# Altium project HMS.PhaoDien.V6.0.PrjPcb (part 1 of 2)
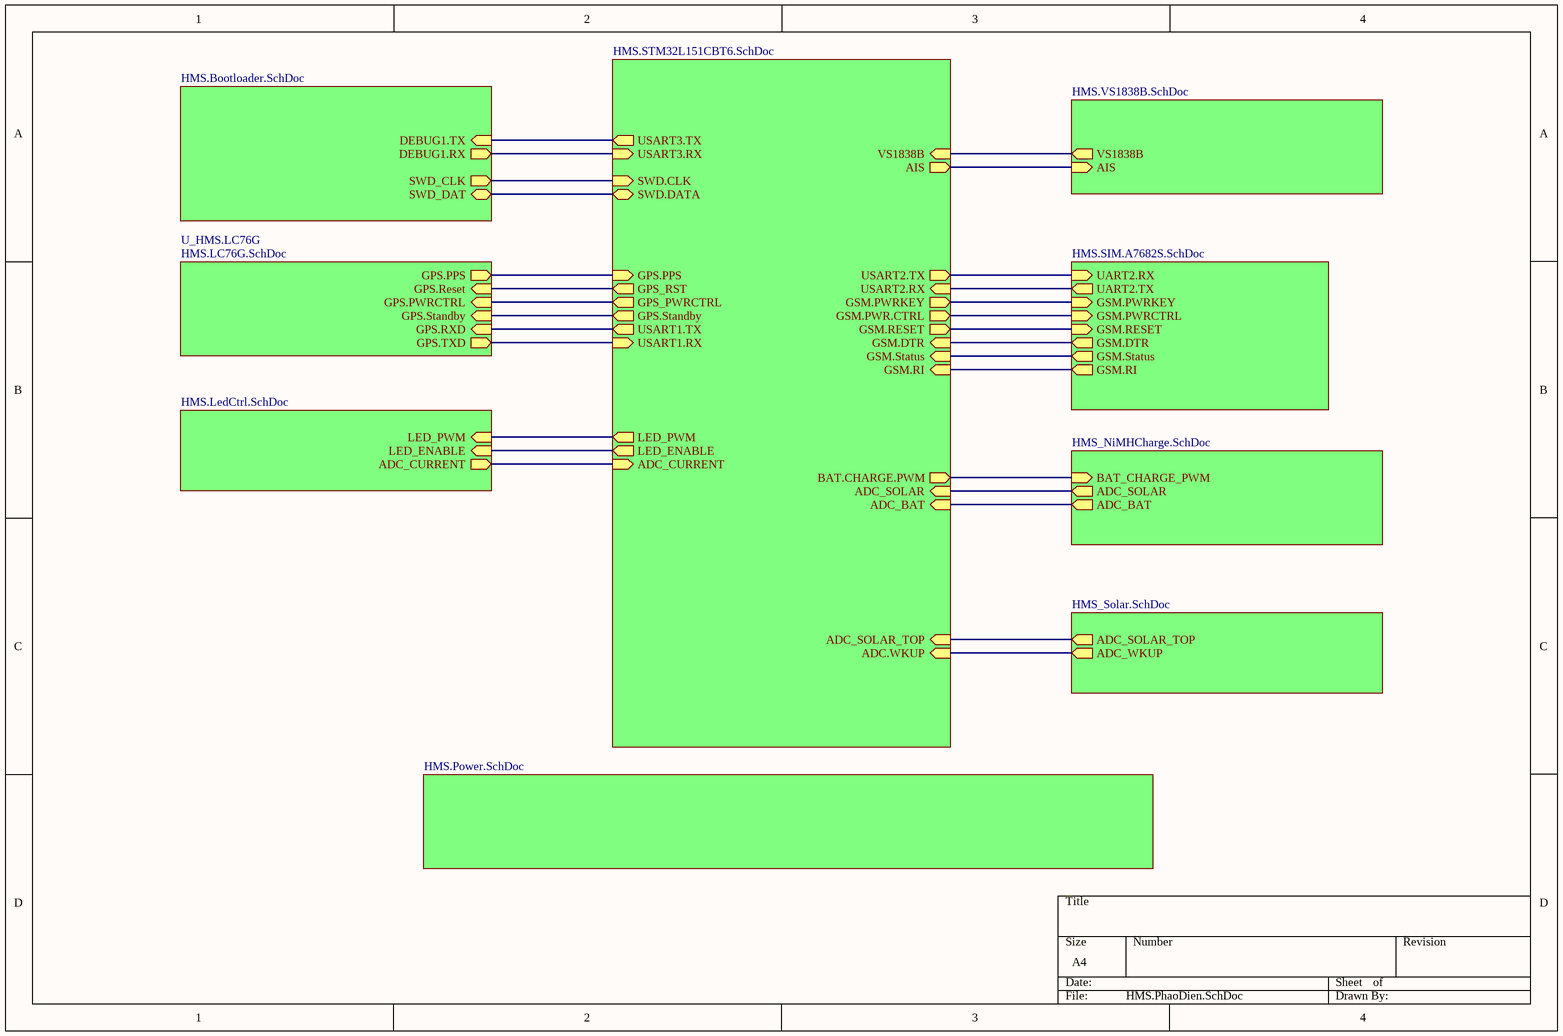
[diagram p0: HMS.PhaoDien.SchDoc]
10 sheets, 125 parts. Net scope: hierarchical (ports join the sheet entries above them; power ports are global).
Board file: 2026.11.05.HMS.PD.CNHH.V6.0.PcbDoc
Sheets:
  HMS.PhaoDien.SchDoc
     = HMS.STM32L151CBT6.SchDoc
     = HMS.Bootloader.SchDoc
     = HMS.LedCtrl.SchDoc
     = HMS.Power.SchDoc
     = HMS.VS1838B.SchDoc
     = HMS_NiMHCharge.SchDoc
     = HMS_Solar.SchDoc
    U_HMS.SIM.A7677S = HMS.SIM.A7682S.SchDoc
    U_HMS.LC76G = HMS.LC76G.SchDoc

## Sheet HMS.PhaoDien.SchDoc
size A4

### Sub-sheets
U_HMS.LC76G = HMS.LC76G.SchDoc: GPS.TXD (out), GPS.RXD (in), GPS.Reset (in), GPS.PWRCTRL (in), GPS.PPS (out), GPS.Standby (in)
U_HMS.SIM.A7677S = HMS.SIM.A7682S.SchDoc: GSM.PWRCTRL (in), GSM.PWRKEY (in), GSM.RESET (in), UART2.RX (in), UART2.TX (out), GSM.DTR (out), GSM.Status (out), GSM.RI (out)
? = HMS.STM32L151CBT6.SchDoc: SWD.DATA (bidir), SWD.CLK (in), LED_PWM (out), LED_ENABLE (out), ADC_CURRENT (in), ADC_SOLAR_TOP (in), ADC_BAT (in), ADC_SOLAR (in), BAT.CHARGE.PWM (out), GPS_RST (out), GPS_PWRCTRL (out), GSM.PWRKEY (out), VS1838B (in), AIS (out), USART1.TX (out), USART1.RX (in), USART2.TX (out), USART2.RX (in), GSM.PWR.CTRL (out), GSM.RESET (out), USART3.TX (out), USART3.RX (in), ADC.WKUP (in), GPS.PPS (in), GSM.RI (in), GSM.Status (in), GSM.DTR (in), GPS.Standby (out)
? = HMS.Bootloader.SchDoc: SWD_CLK (out), SWD_DAT (bidir), DEBUG1.TX (in), DEBUG1.RX (out)
? = HMS.LedCtrl.SchDoc: ADC_CURRENT (out), LED_ENABLE (in), LED_PWM (in)
? = HMS.Power.SchDoc: no entries
? = HMS.VS1838B.SchDoc: VS1838B (out), AIS (in)
? = HMS_NiMHCharge.SchDoc: ADC_SOLAR (out), BAT_CHARGE_PWM (in), ADC_BAT (out)
? = HMS_Solar.SchDoc: ADC_SOLAR_TOP (out), ADC_WKUP (out)

### Nets
USART2.TX: sheet /USART2.TX, sheet U_HMS.SIM.A7677S/UART2.RX
NetC603_2: sheet /ADC_CURRENT, sheet /ADC_CURRENT
NetC801_2: sheet /ADC_SOLAR, sheet /ADC_SOLAR
NetC803_2: sheet /ADC_BAT, sheet /ADC_BAT
NetC900_2: sheet /ADC_SOLAR_TOP, sheet /ADC_SOLAR_TOP
NetIC_2: sheet /LED_ENABLE, sheet /LED_ENABLE
NetMD500_4: sheet /GPS.PPS, sheet U_HMS.LC76G/GPS.PPS
NetMD500_5: sheet /GPS.Standby, sheet U_HMS.LC76G/GPS.Standby
NetMD500_9: sheet /GPS_RST, sheet U_HMS.LC76G/GPS.Reset
NetP2_4: sheet /GSM.DTR, sheet U_HMS.SIM.A7677S/GSM.DTR
NetP2_5: sheet /USART2.RX, sheet U_HMS.SIM.A7677S/UART2.TX
NetP2_6: sheet /GSM.RI, sheet U_HMS.SIM.A7677S/GSM.RI
NetP2_7: sheet /GSM.Status, sheet U_HMS.SIM.A7677S/GSM.Status
NetP2_8: sheet /GSM.PWRKEY, sheet U_HMS.SIM.A7677S/GSM.PWRKEY
NetP2_9: sheet /GSM.RESET, sheet U_HMS.SIM.A7677S/GSM.RESET
NetP2_10: sheet /GSM.PWR.CTRL, sheet U_HMS.SIM.A7677S/GSM.PWRCTRL
NetP100_3: sheet /SWD.CLK, sheet /SWD_CLK
NetP100_7: sheet /SWD.DATA, sheet /SWD_DAT
NetP300_1: sheet /VS1838B, sheet /VS1838B
NetR100_2: sheet /USART3.TX, sheet /DEBUG1.TX
NetR102_2: sheet /USART3.RX, sheet /DEBUG1.RX
NetR500_2: sheet /USART1.RX, sheet U_HMS.LC76G/GPS.TXD
NetR501_2: sheet /USART1.TX, sheet U_HMS.LC76G/GPS.RXD
NetR503_1: sheet /GPS_PWRCTRL, sheet U_HMS.LC76G/GPS.PWRCTRL
NetR604_1: sheet /LED_PWM, sheet /LED_PWM
NetR805_1: sheet /BAT.CHARGE.PWM, sheet /BAT_CHARGE_PWM
NetR902_2: sheet /ADC.WKUP, sheet /ADC_WKUP
NetT300_1: sheet /AIS, sheet /AIS

## Sheet HMS.STM32L151CBT6.SchDoc: HMS.STM32L151CBT6
size A3
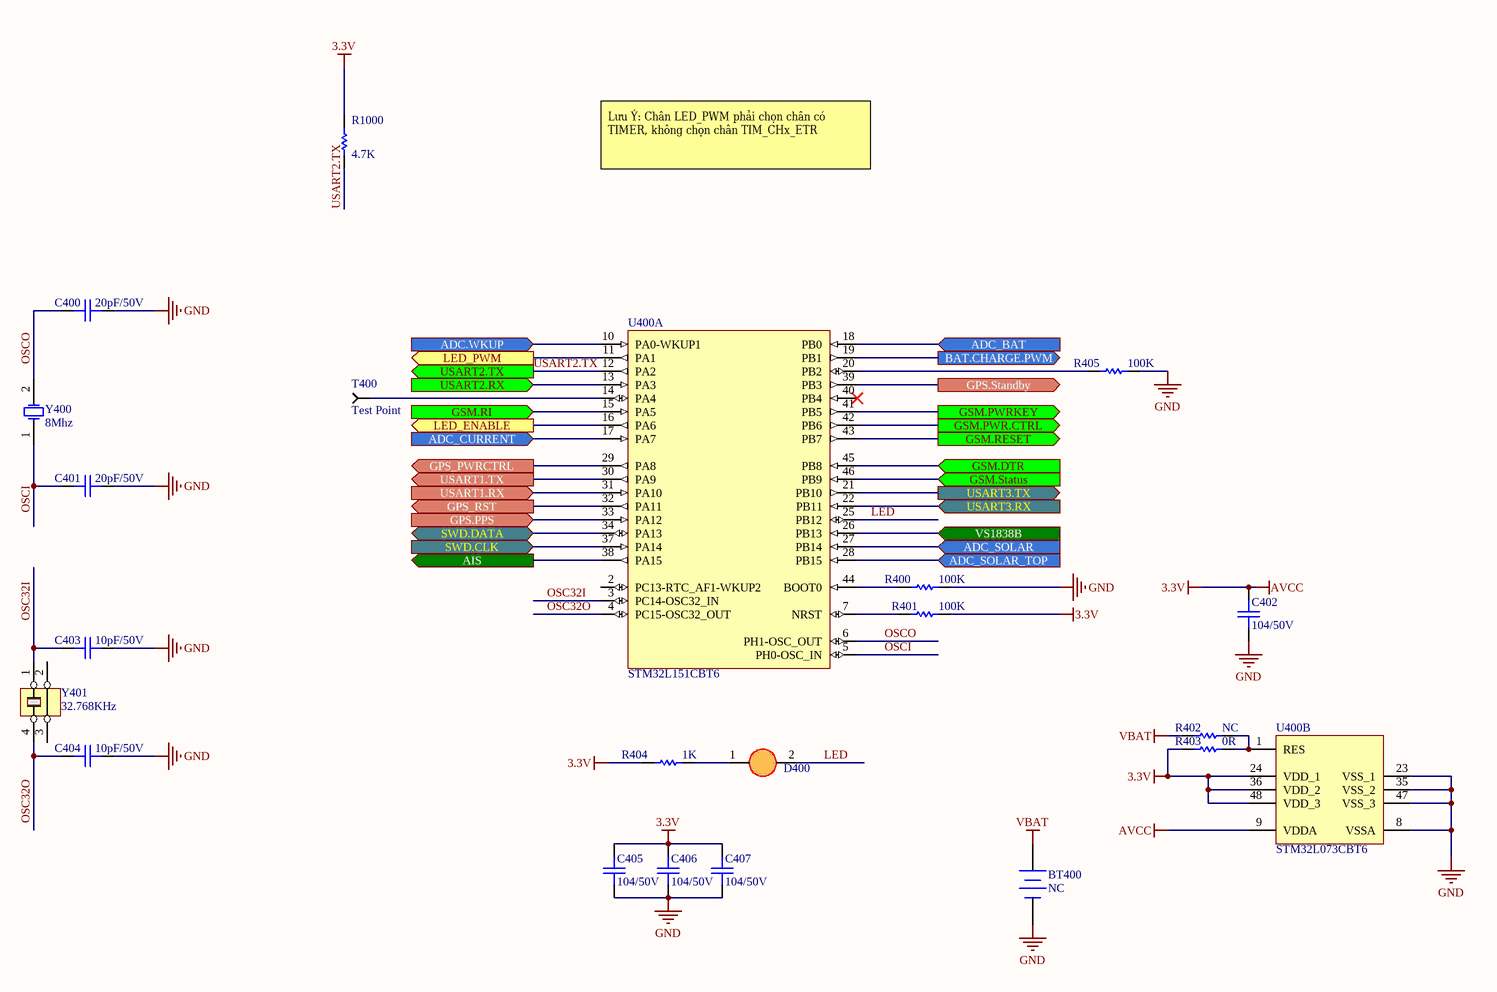
[diagram p1: HMS.STM32L151CBT6.SchDoc]

### Parts
BT400  NC  [DE PIN NHO 3V3]
C400  20pF/50V  [CAP_CERAMIC_0402(1005)]
C401  20pF/50V  [CAP_CERAMIC_0402(1005)]
C402  104/50V  [CAP_CERAMIC_0402(1005)]
C403  10pF/50V  [CAP_CERAMIC_0402(1005)]
C404  10pF/50V  [CAP_CERAMIC_0402(1005)]
C405  104/50V  [CAP_CERAMIC_0402(1005)]
C406  104/50V  [CAP_CERAMIC_0402(1005)]
C407  104/50V  [CAP_CERAMIC_0402(1005)]
D400  LED Red  [LED_0603_GREEN]  (value not drawn)
R400  100K  [RES_0402(1005)]
R401  100K  [RES_0402(1005)]
R402  NC  [RES_0402(1005)]
R403  0R  [RES_0402(1005)]
R404  1K  [RES_0402(1005)]
R405  100K  [RES_0402(1005)]
R1000  4.7K  [RES_0402(1005)]
T400  Test Point  [Test Point SMD]
U400  STM32L151CBT6  [LQFP48_L]  (parts A,B of 2)
Y400  8Mhz  [CRYSTAL_SMD_2PIN-5032]
Y401  32.768KHz  [ABS25-32768-6-T]

### Ports
ADC.WKUP (in), ADC_BAT (in), ADC_CURRENT (in), ADC_SOLAR (in), ADC_SOLAR_TOP (in), AIS (out), BAT.CHARGE.PWM (out), GPS.PPS (in), GPS.Standby (out), GPS_PWRCTRL (out), GPS_RST (out), GSM.DTR (in), GSM.PWR.CTRL (out), GSM.PWRKEY (out), GSM.RESET (out), GSM.RI (in), GSM.Status (in), LED_ENABLE (out), LED_PWM (out), SWD.CLK (in), SWD.DATA (bidir), USART1.RX (in), USART1.TX (out), USART2.RX (in), USART2.TX (out), USART3.RX (in), USART3.TX (out), VS1838B (in)

### Nets
3.3V: C402.2 C405.2 C406.2 C407.2 R401.2 R403.1 R404.1 R1000.2 U400.9(VDDA) U400.24(VDD_1) U400.36(VDD_2) U400.48(VDD_3)  [also labelled AVCC]
GND: BT400.2(-) C400.1 C401.1 C402.1 C403.1 C404.1 C405.1 C406.1 C407.1 R400.1 R405.1 U400.8(VSSA) U400.23(VSS_1) U400.35(VSS_2) U400.47(VSS_3)
VBAT: BT400.1(+) R402.1
LED: D400.2(K) U400.25(PB12)
OSC32I: C403.2 U400.3(PC14-OSC32_IN) Y401.1
OSC32O: C404.2 U400.4(PC15-OSC32_OUT) Y401.4
OSCI: C401.2 U400.5(PH0-OSC_IN) Y400.1(OSC1)
OSCO: C400.2 U400.6(PH1-OSC_OUT) Y400.2(OSC2)
USART2.TX: R1000.1 U400.12(PA2) ; port USART2.TX
NetC603_2: U400.17(PA7) ; port ADC_CURRENT
NetC801_2: U400.27(PB14) ; port ADC_SOLAR
NetC803_2: U400.18(PB0) ; port ADC_BAT
NetC900_2: U400.28(PB15) ; port ADC_SOLAR_TOP
NetD400_1: D400.1(A) R404.2
NetIC_2: U400.16(PA6) ; port LED_ENABLE
NetMD500_4: U400.33(PA12) ; port GPS.PPS
NetMD500_5: U400.39(PB3) ; port GPS.Standby
NetMD500_9: U400.32(PA11) ; port GPS_RST
NetP2_4: U400.45(PB8) ; port GSM.DTR
NetP2_5: U400.13(PA3) ; port USART2.RX
NetP2_6: U400.15(PA5) ; port GSM.RI
NetP2_7: U400.46(PB9) ; port GSM.Status
NetP2_8: U400.41(PB5) ; port GSM.PWRKEY
NetP2_9: U400.43(PB7) ; port GSM.RESET
NetP2_10: U400.42(PB6) ; port GSM.PWR.CTRL
NetP100_3: U400.37(PA14) ; port SWD.CLK
NetP100_7: U400.34(PA13) ; port SWD.DATA
NetP300_1: U400.26(PB13) ; port VS1838B
NetR100_2: U400.21(PB10) ; port USART3.TX
NetR102_2: U400.22(PB11) ; port USART3.RX
NetR400_2: R400.2 U400.44(BOOT0)
NetR401_1: R401.1 U400.7(NRST)
NetR402_2: R402.2 R403.2 U400.1(RES)
NetR405_2: R405.2 U400.20(PB2)
NetR500_2: U400.31(PA10) ; port USART1.RX
NetR501_2: U400.30(PA9) ; port USART1.TX
NetR503_1: U400.29(PA8) ; port GPS_PWRCTRL
NetR604_1: U400.11(PA1) ; port LED_PWM
NetR805_1: U400.19(PB1) ; port BAT.CHARGE.PWM
NetR902_2: U400.10(PA0-WKUP1) ; port ADC.WKUP
NetT300_1: U400.38(PA15) ; port AIS
NetT400_1: T400.1 U400.14(PA4)

Not connected (* = marked no-connect by the designer): U400 2(PC13-RTC_AF1-WKUP2) 40(PB4)*; Y401 2 3

### Notes on the sheet
- Lưu Ý: Chân LED_PWM phải chọn chân có TIMER, không chọn chân TIM_CHx_ETR
- Title
- Size:
- Date:
- A3
- Number:
- Time:
- Revision:
- Sheet
- of
- File:

### Library data of the parts
BT400 = Battery: Published: 24-Mar-1999; LatestRevisionDate: 17-Jul-2002; LatestRevisionNote: Re-released for DXP Platform.; PackageReference: BAT-2; Publisher: Altium Limited; PackageDescription: Battery; 2 Leads; Value: NC
C400 C401 = Cap Cer 0603 (1608): CAP CER 20PF 50V C0G/NP0 0402; MPN: CQ0402FRNPO9BN200; Published: 8-Jun-2000; LatestRevisionDate: 17-Jul-2002; LatestRevisionNote: Re-released for DXP Platform.; PackageReference: RAD-0.3; Publisher: Altium Limited; Value: 20pF/50V
C402 C405-C407 = C0603C104K5RACTU: CAP CER 0.1UF 50V X5R 0402; MPN: CC0402KRX5R9BB104; CompanyID: VT-00982; Solder: SMT; Value: 104/50V; Category: CAPACITOR
C403 C404 = Cap Cer 0603 (1608): CAP CER 10pF 50V NP0 0402; MPN: CC0402JRNPO9BN100; Published: 8-Jun-2000; LatestRevisionDate: 17-Jul-2002; LatestRevisionNote: Re-released for DXP Platform.; PackageReference: RAD-0.3; Publisher: Altium Limited; Value: 10pF/50V
D400 = LED 3mm: LED RED SMD 0402; MPN: NCD0603R1; Value: LED Red
R400 R401 R405 = Res1: Resistor 100K 1/8W 1% 0402; MPN: RC0402FR-07100KL; Published: 8-Jun-2000; LatestRevisionDate: 17-Jul-2002; LatestRevisionNote: Re-released for DXP Platform.; PackageReference: AXIAL-0.3; Publisher: Altium Limited; Value: 100K
R402 = Res1: Resistor; Published: 8-Jun-2000; LatestRevisionDate: 17-Jul-2002; LatestRevisionNote: Re-released for DXP Platform.; PackageReference: AXIAL-0.3; Publisher: Altium Limited; Value: NC
R403 = Res1: RES 0 OHM 1/8W 0402; MPN: CRCW04020000Z0EDC; Published: 8-Jun-2000; LatestRevisionDate: 17-Jul-2002; LatestRevisionNote: Re-released for DXP Platform.; PackageReference: AXIAL-0.3; Publisher: Altium Limited; Value: 0R
R404 = Res1: RES 1K OHM 1% 1/8W 0402; MPN: RC0402FR-071KL; Published: 8-Jun-2000; LatestRevisionDate: 17-Jul-2002; LatestRevisionNote: Re-released for DXP Platform.; PackageReference: AXIAL-0.3; Publisher: Altium Limited; Value: 1K
R1000 = Res1: RES 4.7kΩ ±1% 62.5mW 0402; MPN: RC0402FR-074K7L; MFR: Vishay Dale; Published: 8-Jun-2000; LatestRevisionDate: 17-Jul-2002; LatestRevisionNote: Re-released for DXP Platform.; PackageReference: AXIAL-0.3; Publisher: Altium Limited; PackageDescription: Axial Device, Thru-Hole; 2 Leads; 0.3 in Pin Spacing; Value: 4.7K; Category: Chip Resistor - Surface Mount
U400 = STM32L151CBT6: STM32L ARM-based EnergyLite 32-bit MCU, 128 kB Flash, 16 kB Internal RAM, -40 to +85°C Temperature, 32-pin LQFP, Tray; DatasheetVersion: rev6, Jan-2012; PackageVersion: rev13, Apr-2011; PackageReference: LQFP48; PackageDescription: 48-Pin Low-Profile Quad Flat Pack, 7 x 7 mm Body, 0.5 mm Pitch (LQFP48); ComponentLink1Description: Manufacturer URL; ComponentLink1URL: http://www.st.com/; ComponentLink2Description: STM32L151/152 Datasheet; ComponentLink2URL: http://www.st.com/internet/com/TECHNICAL_RESOURCES/TECHNICAL_LITERATURE/DATASHEET/CD00277537.pdf; ComponentLink3Description: STM32 L1 Family Web Page; ComponentLink3URL: http://www.st.com/internet/mcu/subclass/1376.jsp; Value: STM32L151CBT6; MPN: STM32L151CBT6
Y400 = XTAL: Crystal 8Mhz 20pF SMD 5032; MPN: ABM3-8.000MHz-12-D4Y-T; Published: 8-Jun-2000; LatestRevisionDate: 17-Jul-2002; LatestRevisionNote: Re-released for DXP Platform.; PackageReference: R38; Publisher: Altium Limited; PackageDescription: Crystal, Thru-Hole; 2 Leads; Body 3.1 x 8.2 mm (Dia.xH); Value: 8Mhz
Y401 = ABS25-32768-6-T: CRYSTAL 32.768KHZ 6PF SMD; Manufacturer: Abracon Corporation; Manufacturer Part Number: ABS25-32.768KHZ-6-T; Frequency Tolerance: ±20ppm; ESR (Equivalent Series Resistance): 50 kOhm; Operating Mode: Fundamental; Supplier 1: Digi-Key; RoHS: RoHS Compliant; Category: Crystals and Oscillators; Stock 1: 51000; Pricing 1: 3000=0.285, 6000=0.2755, 15000=0.266 (USD); Packaging: Tape & Reel (TR); Type: kHz Crystal (Tuning Fork); Frequency: 32.768kHz; Frequency Stability: -; Load Capacitance: 6pF; Operating Temperature: -40°C ~ 85°C; Ratings: -; Mounting Type: Surface Mount; Package / Case: 4-SOJ, 5.50mm pitch; Size / Dimension: 0.315" L x 0.150" W (8.00mm x 3.80mm); Height: 0.098" (2.50mm); ComponentLink1URL: http://www.abracon.com/Resonators/abs25.pdf; ComponentLink1Description: http://www.abracon.com/Resonators/abs25.pdf; Supplier Part Number 1: 535-10240-2-ND; Value: 32.768KHz; MPN: ABS25-32768-6-T

## Sheet HMS.Bootloader.SchDoc
size A
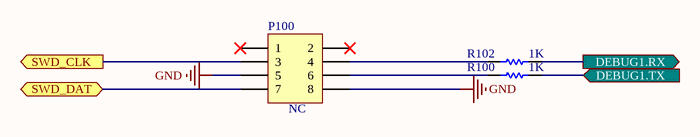
[diagram p2: HMS.Bootloader.SchDoc]

### Parts
P100  NC  [HDR2X4]
R100  1K  [RES_0402(1005)]
R102  1K  [RES_0402(1005)]

### Ports
DEBUG1.RX (out), DEBUG1.TX (in), SWD_CLK (out), SWD_DAT (bidir)

### Nets
GND: P100.5 P100.8
NetP100_3: P100.3 ; port SWD_CLK
NetP100_4: P100.4 R102.1
NetP100_6: P100.6 R100.1
NetP100_7: P100.7 ; port SWD_DAT
NetR100_2: R100.2 ; port DEBUG1.TX
NetR102_2: R102.2 ; port DEBUG1.RX

Not connected (* = marked no-connect by the designer): P100 1* 2*

### Library data of the parts
P100 = Header 4X2: Header, 4-Pin, Dual row; LatestRevisionDate: 17-Jul-2002; LatestRevisionNote: Re-released for DXP Platform.; Publisher: Altium Limited; MPN: NC; Value: NC
R100 R102 = Res1: as R404 on sheet HMS.STM32L151CBT6; Published: 8-Jun-2000; LatestRevisionDate: 17-Jul-2002; LatestRevisionNote: Re-released for DXP Platform.; PackageReference: AXIAL-0.3; Publisher: Altium Limited; Value: 1K

## Sheet HMS.LedCtrl.SchDoc
size A
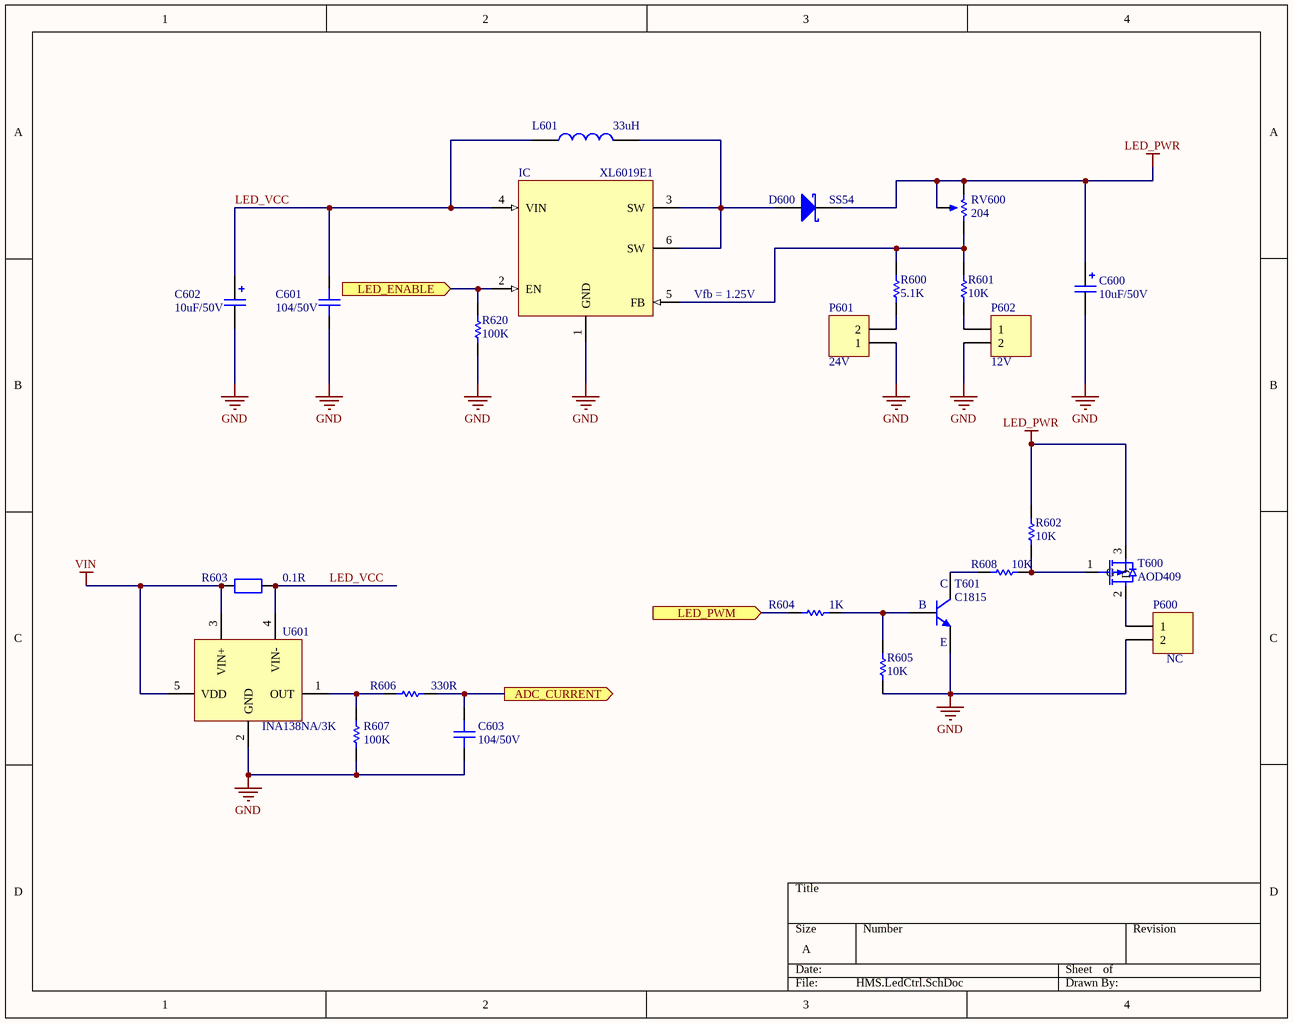
[diagram p3: HMS.LedCtrl.SchDoc]

### Parts
C600  10uF/50V  [CAP_ALUM_SMD_5054_TYPE_C]
C601  104/50V  [CAP_CERAMIC_0402(1005)]
C602  10uF/50V  [CAP_ALUM_SMD_5054_TYPE_C]
C603  104/50V  [CAP_CERAMIC_0402(1005)]
D600  SS54  [DO214AC_SMA_1808]
IC  XL6019E1  [TO-263-5]
L601  33uH  [L3A_10x10x4mm]
P600  NC  [H2_BIG]
P601  24V  [HDR1X2]
P602  12V  [HDR1X2]
R600  5.1K  [RES_0402(1005)]
R601  10K  [RES_0402(1005)]
R602  10K  [RES_0402(1005)]
R603  0.1R  [RES_2512]
R604  1K  [RES_0402(1005)]
R605  10K  [RES_0402(1005)]
R606  330R  [RES_0402(1005)]
R607  100K  [RES_0402(1005)]
R608  10K  [RES_0402(1005)]
R620  100K  [RES_0402(1005)]
RV600  204  [RES_VAR_Type1]
T600  AOD409  [TO252]
T601  C1815  [SOT23-3]
U601  INA138NA/3K  [SOT23-5]

### Ports
ADC_CURRENT (out), LED_ENABLE (in), LED_PWM (in)

### Nets
GND: C600.2 C601.1 C602.2 C603.1 IC.1(GND) P600.2 P601.1 P602.2 R605.1 R607.1 R620.1 T601.2 U601.2(GND)
LED_PWR: C600.1 D600.2(K) R602.2 RV600.2 RV600.3 T600.3(S)
VIN: R603.1 U601.3(VIN+) U601.5(VDD)
LED_VCC: C601.2 C602.1 IC.4(VIN) L601.1 R603.2 U601.4(VIN-)
NetC603_2: C603.2 R606.2 ; port ADC_CURRENT
NetD600_1: D600.1(A) IC.3(SW) IC.6(SW) L601.2
NetIC_2: IC.2(EN) R620.2 ; port LED_ENABLE
NetIC_5: IC.5(FB) R600.2 R601.2 RV600.1
NetP600_1: P600.1 T600.2(D)
NetP601_2: P601.2 R600.1
NetP602_1: P602.1 R601.1
NetR602_1: R602.1 R608.1 T600.1(G)
NetR604_1: R604.1 ; port LED_PWM
NetR604_2: R604.2 R605.2 T601.1
NetR606_1: R606.1 R607.2 U601.1(OUT)
NetR608_2: R608.2 T601.3

### Notes on the sheet
- (near IC) Vfb = 1.25V
- (in symbol 2SC1815-HF) C; B; E

### Library data of the parts
C600 C602 = Cap Tantal 2917 (7343-31): Capacitor Alum 10uF/50V SMD 5x5.4mm; MPN: AVS106M50C12T-F; Value: 10uF/50V
C601 = Cap Cer 0805 (2012): CAP CER 0.1UF 50V X5R 0402; MPN: CC0402KRX5R9BB104; Published: 8-Jun-2000; LatestRevisionDate: 17-Jul-2002; LatestRevisionNote: Re-released for DXP Platform.; PackageReference: RAD-0.3; Publisher: Altium Limited; Value: 104/50V
C603 = Cap Cer 0603 (1608): CAP CER 0.1UF 50V X5R 0402; MPN: CC0402KRX5R9BB104; Published: 8-Jun-2000; LatestRevisionDate: 17-Jul-2002; LatestRevisionNote: Re-released for DXP Platform.; PackageReference: RAD-0.3; Publisher: Altium Limited; Value: 104/50V
D600 = Diode B340A: Diode Schottky 5A/40V DO-214AB; Published: 8-Jun-2000; LatestRevisionDate: 17-Jul-2002; LatestRevisionNote: Re-released for DXP Platform.; PackageReference: SMB; Publisher: Altium Limited; Code_JEDEC: DO-214-AA; MPN: SS54; Value: SS54
IC = XL6019E1: XL6019E1 IC Boost 5A TO-263-5; MPN: XL6019E1; Value: XL6019E1
L601 = CBC2012T470M: INDUCTOR 33uH SMD CDRH127-330; Manufacturer: Taiyo Yuden; Inductance: 47uH; Current Rating: 150mA; Current - Saturation: 120mA; Tolerance: ±20%; Shielding: Unshielded; DC Resistance (DCR): 7.54 Ohm Max; Frequency - Self Resonant: 11MHz; Frequency - Test: 2.52MHz; Supplier 1: Digi-Key; Manufacturer Part Number: CBC2012T470M; RoHS: RoHS Compliant; Category: Inductors, Coils, Chokes; Stock 1: 108934; Pricing 1: 1=0.2, 10=0.188, 50=0.1762, 100=0.1645, 500=0.12926, 1000=0.10575 (USD); Packaging: Cut Tape (CT); Type: -; Material - Core: -; Q @ Freq: -; Operating Temperature: -40°C ~ 105°C; Package / Case: 0805 (2012 Metric); Size / Dimension: 0.079" L x 0.049" W x 0.049" H (2.00mm x 1.25mm x 1.25mm); Mounting Type: Surface Mount; ComponentLink1URL: http://www.yuden.co.jp/ut/product/category/inductor/CBC2012T470M.pdf; ComponentLink1Description: http://www.yuden.co.jp/ut/product/category/inductor/CBC2012T470M.pdf; Supplier Part Number 1: 587-1605-1-ND; Value: 33uH; MPN: CDRH127-330
P600 = Header 2: Header, 2-Pin; LatestRevisionDate: 17-Jul-2002; LatestRevisionNote: Re-released for DXP Platform.; Publisher: Altium Limited; Value: NC; MPN: NC
P601 P602 = Header 2: Header, 2-Pin; MPN: NC; LatestRevisionDate: 17-Jul-2002; LatestRevisionNote: Re-released for DXP Platform.; Publisher: Altium Limited
R600 = Res1: RES 5.1K OHM 5% 1/8W 0402; MPN: RC0402JR-075K1L; Published: 8-Jun-2000; LatestRevisionDate: 17-Jul-2002; LatestRevisionNote: Re-released for DXP Platform.; PackageReference: AXIAL-0.3; Publisher: Altium Limited; Value: 5.1K
R601 R602 R605 R608 = Res1: RES 10K OHM 5% 1/8W 0402; MPN: RC0402JR-0710KL; Published: 8-Jun-2000; LatestRevisionDate: 17-Jul-2002; LatestRevisionNote: Re-released for DXP Platform.; PackageReference: AXIAL-0.3; Publisher: Altium Limited; Value: 10K
R603 = Res 1W: Res 1W 0.1R 1% SMD 2512; MPN: RL2512FK-070R1L; Value: 0.1R
R604 = Res1: as R404 on sheet HMS.STM32L151CBT6; Published: 8-Jun-2000; LatestRevisionDate: 17-Jul-2002; LatestRevisionNote: Re-released for DXP Platform.; PackageReference: AXIAL-0.3; Publisher: Altium Limited; Value: 1K
R606 = Res1: RES 330 OHM 1% 1/8W 0402; MPN: RC0402FR-07330RL; Published: 8-Jun-2000; LatestRevisionDate: 17-Jul-2002; LatestRevisionNote: Re-released for DXP Platform.; PackageReference: AXIAL-0.3; Publisher: Altium Limited; Value: 330R
R607 = Res1: as R400 on sheet HMS.STM32L151CBT6; Published: 8-Jun-2000; LatestRevisionDate: 17-Jul-2002; LatestRevisionNote: Re-released for DXP Platform.; PackageReference: AXIAL-0.3; Publisher: Altium Limited; Value: 100K
R620 = Res1: RES 100K OHM 5% 1/8W 0402; MPN: RC0402JR-07100KL; Published: 8-Jun-2000; LatestRevisionDate: 17-Jul-2002; LatestRevisionNote: Re-released for DXP Platform.; PackageReference: AXIAL-0.3; Publisher: Altium Limited; Value: 100K
RV600 = Res_Vol_Single: Volume Varistor Single 200K; MPN: 3296W-204; Sim Note: Enter the Resistance value and the set point into parameter fields.; Set Position: 0.5; Published: 8-Jun-2000; LatestRevisionDate: 17-Jul-2002; LatestRevisionNote: Re-released for DXP Platform.; PackageReference: 3296W-204; Publisher: Altium Limited; Value: 204
T600 = AOD4185: MOSFET P-CH 60V 26A TO252; Manufacturer: International Rectifier; FET Type: MOSFET P-Channel, Metal Oxide; FET Feature: Logic Level Gate; Drain to Source Voltage (Vdss): 20V; Current - Continuous Drain (Id) @ 25° C: 3.7A (Ta); Rds On (Max) @ Id, Vgs: 65 mOhm @ 3.7A, 4.5V; Vgs(th) (Max) @ Id: 1.2V @ 250µA; Gate Charge (Qg) @ Vgs: 12nC @ 5V; Input Capacitance (Ciss) @ Vds: 633pF @ 10V; Power - Max: 1.3W; Supplier 1: Digi-Key; RoHS: RoHS Compliant; Category: Discrete Semiconductor Products; Stock 1: 4068; Pricing 1: 1=0.6, 10=0.34, 25=0.2932, 50=0.2468, 100=0.2209, 250=0.20072, 500=0.18058, 1000=0.16904 (USD); Packaging: Digi-Reel®; Mounting Type: Surface Mount; Package / Case: TO-236-3, SC-59, SOT-23-3; Supplier Device Package: Micro3™/SOT-23; ComponentLink1URL: http://www.irf.com/product-info/datasheets/data/irlml6402gpbf.pdf; ComponentLink1Description: http://www.irf.com/product-info/datasheets/data/irlml6402gpbf.pdf; Supplier Part Number 1: IRLML6402GTRPBFDKR-ND; Value: AOD409; MPN: AOD409
T601 = 2SC1815-HF: Trans C1815 NPN 0.15A/50V SMD SOT23; Value: C1815; MPN: 2SC1815
U601 = INA138: IC Current Monitor Regulator 0.5% SOT-23-5; Value: INA138NA/3K; MPN: INA138NA/3K

## Sheet HMS.Power.SchDoc
size A4
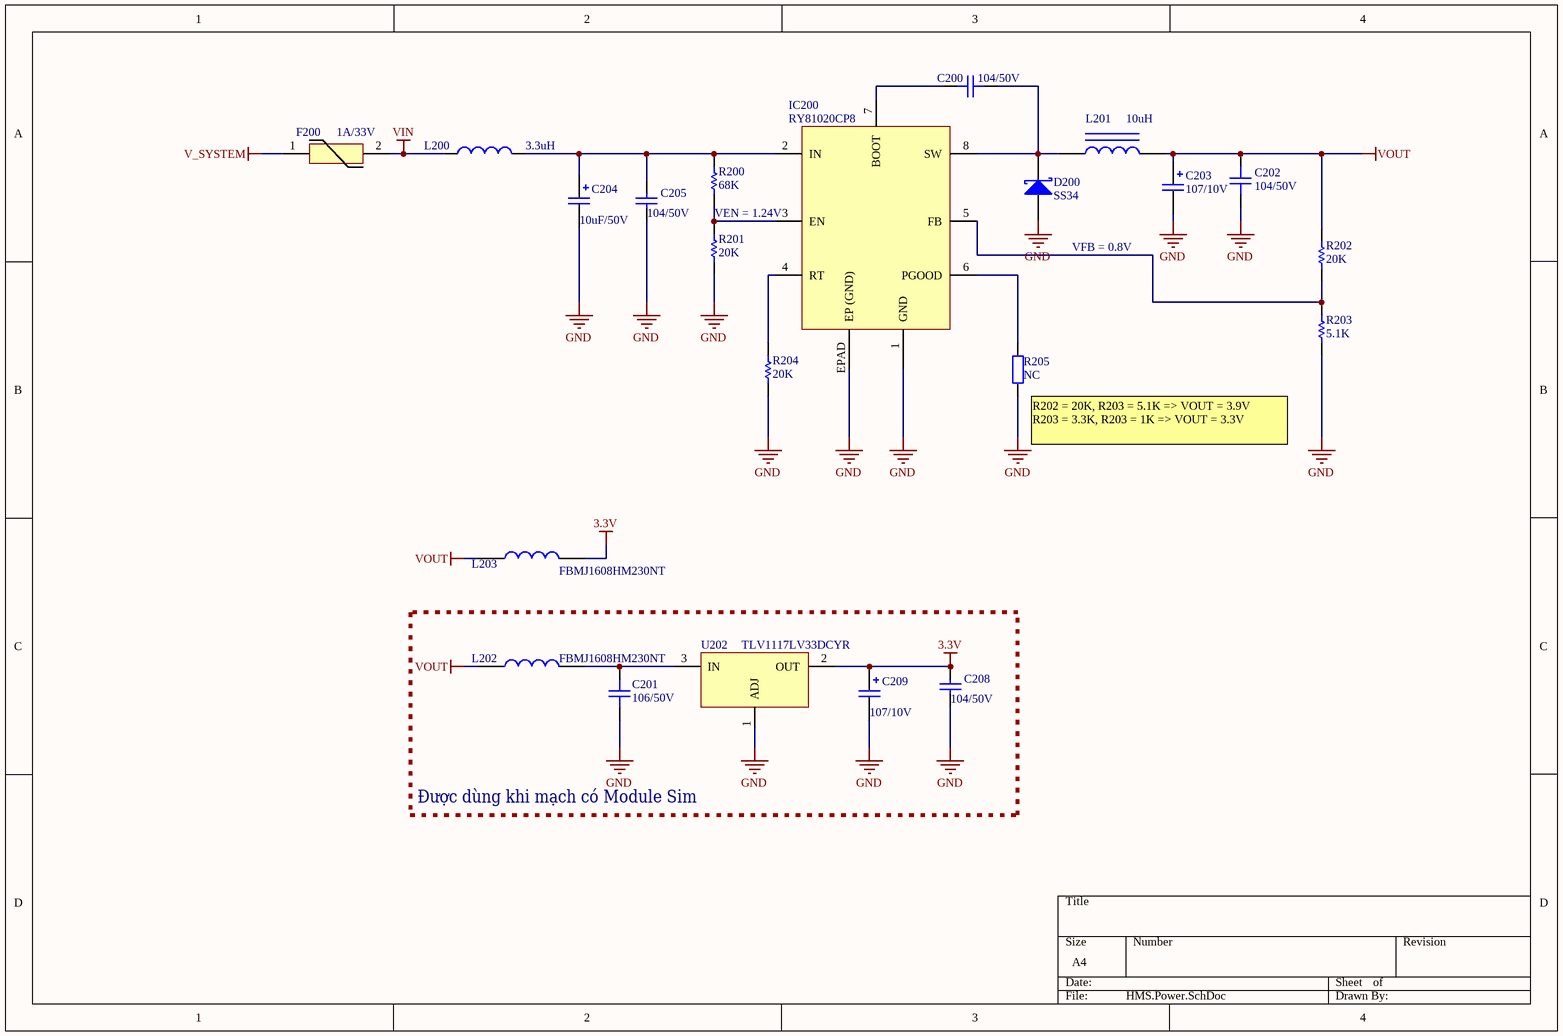
[diagram p4: HMS.Power.SchDoc]

### Parts
C200  104/50V  [CAP_CERAMIC_0402(1005)]
C201  106/50V  [CAP_CERAMIC_1206(3216-18)]
C202  104/50V  [CAP_CERAMIC_0402(1005)]
C203  107/10V  [CAP_TANTAL_2312(6032-28)]
C204  10uF/50V  [CAP_ALUM_SMD_5054_TYPE_C]
C205  104/50V  [CAP_CERAMIC_0402(1005)]
C208  104/50V  [CAP_CERAMIC_0402(1005)]
C209  107/10V  [CAP_TANTAL_2312(6032-28)]
D200  SS34  [DO214AC_SMA_1808]
F200  1A/33V  [MF-MSMF]
IC200  RY81020CP8  [MK9019]
L200  3.3uH  [L2.1A_3.5_3.3]
L201  10uH  [L3A_7x7x3mm]
L202  FBMJ1608HM230NT  [Inductor_0603]
L203  FBMJ1608HM230NT  [Inductor_0603]
R200  68K  [RES_0402(1005)]
R201  20K  [RES_0402(1005)]
R202  20K  [RES_0402(1005)]
R203  5.1K  [RES_0402(1005)]
R204  20K  [RES_0402(1005)]
R205  NC  [RES_0402(1005)]
U202  TLV1117LV33DCYR  [LM1117-SOP]

### Blocks framed on the sheet
Được dùng khi mạch có Module Sim: C201 C208 C209 L202 U202

### Nets
3.3V: C208.2 C209.1 L203.2 U202.2(OUT)
GND: C201.1 C202.1 C203.2 C204.2 C205.1 C208.1 C209.2 D200.1(A) IC200.1(GND) IC200.EPAD(EP_(GND)) R201.1 R203.1 R204.1 R205.1 U202.1(ADJ)
V_SYSTEM: F200.1
VIN: F200.2 L200.1
VOUT: C202.2 C203.1 L201.2 L202.1 L203.1 R202.2
NetC200_1: C200.1 D200.2(K) IC200.8(SW) L201.1
NetC200_2: C200.2 IC200.7(BOOT)
NetC201_2: C201.2 L202.2 U202.3(IN)
NetC204_1: C204.1 C205.2 IC200.2(IN) L200.2 R200.2
NetIC200_3: IC200.3(EN) R200.1 R201.2
NetIC200_4: IC200.4(RT) R204.2
NetIC200_5: IC200.5(FB) R202.1 R203.2
NetIC200_6: IC200.6(PGOOD) R205.2

### Notes on the sheet
- VEN = 1.24V
- VFB = 0.8V
- (near R205) R202 = 20K, R203 = 5.1K => VOUT = 3.9V
  R203 = 3.3K, R203 = 1K => VOUT = 3.3V

### Library data of the parts
C200 C202 = Cap Cer 0603 (1608): CAP CER 0.1UF 50V X5R 0402; MPN: CC0402KRX5R9BB104; MFR: YAGEO; Published: 8-Jun-2000; LatestRevisionDate: 17-Jul-2002; LatestRevisionNote: Re-released for DXP Platform.; PackageReference: RAD-0.3; Publisher: Altium Limited; Value: 104/50V; Category: Ceramic Capacitors
C201 = CL31A106KOHNNNE: CAP Ceramic 106/50V 10% 1206; MPN: CL31A106KBHNNNE; MFR: YAGEO; Value: 106/50V
C203 = Cap Tantal 2312 (6032-28): Capacitor Tantalum 100uF/10V 2312(6032-28); MPN: TPSC107K010R0100; Value: 107/10V
C204 = UWT1C221MCL1GS: Capacitor Alum 10uF/50V SMD 5x5.4mm; Manufacturer: Nichicon; MPN: AVS106M50C12T-F; Capacitance: 220µF; Voltage Rating: 16V; Tolerance: ±20%; Lifetime @ Temp.: 1000 Hrs @ 105°C; Ripple Current: 105mA; Surface Mount Land Size: 0.260" L x 0.260" W (6.60mm x 6.60mm); Supplier 1: Digi-Key; Manufacturer Part Number: UWT1C221MCL1GS; RoHS: RoHS Compliant; Category: Capacitors; Stock 1: 45106; Pricing 1: 1=0.46, 10=0.366, 100=0.2205, 250=0.16536 (USD); Operating Temperature: -55°C ~ 105°C; Features: General Purpose; ESR (Equivalent Series Resistance): -; Impedance: -; Mounting Type: Surface Mount; Package / Case: Radial, Can - SMD; Size / Dimension: 0.248" Dia (6.30mm); Height - Seated (Max): 0.303" (7.70mm); Lead Spacing: -; Packaging: Cut Tape (CT); ComponentLink1URL: http://www.nichicon.co.jp/english/products/pdfs/e-wt.pdf; ComponentLink1Description: http://www.nichicon.co.jp/english/products/pdfs/e-wt.pdf; Supplier Part Number 1: 493-2179-1-ND; Value: 10uF/50V
C205 C208 = Cap: CAP CER 0.1UF 50V X5R 0402; MPN: CC0402KRX5R9BB104; Published: 8-Jun-2000; LatestRevisionDate: 17-Jul-2002; LatestRevisionNote: Re-released for DXP Platform.; PackageReference: RAD-0.3; Publisher: Altium Limited; Value: 104/50V
C209 = UWT1C221MCL1GS: Cap Tantal 10uF/6.3V 10% 1206; Manufacturer: Nichicon; MPN: 293D106X96R3A2TE3; Capacitance: 220µF; Voltage Rating: 6.3V; Tolerance: ±20%; Lifetime @ Temp.: 1000 Hrs @ 105°C; Ripple Current: 105mA; Surface Mount Land Size: 0.260" L x 0.260" W (6.60mm x 6.60mm); Supplier 1: Digi-Key; Manufacturer Part Number: UWT1C221MCL1GS; RoHS: RoHS Compliant; Category: Capacitors; Stock 1: 45106; Pricing 1: 1=0.46, 10=0.366, 100=0.2205, 250=0.16536 (USD); Operating Temperature: -55°C ~ 105°C; Features: General Purpose; ESR (Equivalent Series Resistance): -; Impedance: -; Mounting Type: Surface Mount; Package / Case: Radial, Can - SMD; Size / Dimension: 0.248" Dia (6.30mm); Height - Seated (Max): 0.303" (7.70mm); Lead Spacing: -; Packaging: Cut Tape (CT); ComponentLink1URL: http://www.nichicon.co.jp/english/products/pdfs/e-wt.pdf; ComponentLink1Description: http://www.nichicon.co.jp/english/products/pdfs/e-wt.pdf; Supplier Part Number 1: 493-2179-1-ND; Value: 107/10V
D200 = Diode B340A: Diode Schottky 3A/40V DO-214AB; MFR: Diodes Incorporated; Published: 8-Jun-2000; LatestRevisionDate: 17-Jul-2002; LatestRevisionNote: Re-released for DXP Platform.; PackageReference: SMB; Publisher: Altium Limited; Code_JEDEC: DO-214-AA; Value: SS34; MPN: SS34; Category: Diodes - Rectifiers - Single
F200 = RKEF110: PTC RESET FUSE 33V 1A SMD 1812; MPN: KMC5S110RY33; MFR: Littelfuse Inc.; Solder: WAVE; Value: 1A/33V
IC200 = MK9019: 100V Input, Ultra-Low IQ, Synchronous Buck Converter; Value: RY81020CP8; MPN: RY81020CP8
L200 = Inductor: Inductor SMD 3.3uH CD43-3R3 3.5*3*2.1mm; MPN: XRCD43-3R3M; Published: 8-Jun-2000; Revision: July-2002: Re-released for DXP Platform.; Publisher: Altium Limited; Value: 3.3uH
L201 = Inductor Iron: Inductor 10uH 7x7x4mm; MPN: YPRH0704-100M; Published: 24-Mar-1999; LatestRevisionDate: 17-Jul-2002; LatestRevisionNote: Re-released for DXP Platform.; PackageReference: AXIAL-0.9; Publisher: Altium Limited; Value: 10uH
L202 L203 = CBC2012T470M: Inductor Ferrites 4A SMD 0603; Manufacturer: Taiyo Yuden; Inductance: 200nH; Current Rating: 150mA; Current - Saturation: 120mA; Tolerance: ±20%; Shielding: Unshielded; DC Resistance (DCR): 7.54 Ohm Max; Frequency - Self Resonant: 11MHz; Frequency - Test: 2.52MHz; Supplier 1: Digi-Key; Manufacturer Part Number: CBC2012T470M; RoHS: RoHS Compliant; Category: Inductors, Coils, Chokes; Stock 1: 108934; Pricing 1: 1=0.2, 10=0.188, 50=0.1762, 100=0.1645, 500=0.12926, 1000=0.10575 (USD); Packaging: Cut Tape (CT); Type: -; Material - Core: -; Q @ Freq: -; Operating Temperature: -40°C ~ 105°C; Package / Case: 0805 (2012 Metric); Size / Dimension: 0.079" L x 0.049" W x 0.049" H (2.00mm x 1.25mm x 1.25mm); Mounting Type: Surface Mount; ComponentLink1URL: http://www.yuden.co.jp/ut/product/category/inductor/CBC2012T470M.pdf; ComponentLink1Description: http://www.yuden.co.jp/ut/product/category/inductor/CBC2012T470M.pdf; Supplier Part Number 1: 587-1605-1-ND; Value: FBMJ1608HM230NT; MPN: FBMJ1608HM230NT
R200 = Res1: RES 68K OHM 5% 1/8W 0402; MPN: RC0402FR-0768KL; Published: 8-Jun-2000; LatestRevisionDate: 17-Jul-2002; LatestRevisionNote: Re-released for DXP Platform.; PackageReference: AXIAL-0.3; Publisher: Altium Limited; Value: 68K
R201 = Res1: RES 20K OHM 1% 1/8W 0402; MPN: RC0402FR-0720KL; Published: 8-Jun-2000; LatestRevisionDate: 17-Jul-2002; LatestRevisionNote: Re-released for DXP Platform.; PackageReference: AXIAL-0.3; Publisher: Altium Limited; Value: 20K
R202 = Res1: RES 20K OHM 5% 1/8W 0402; MPN: RC0402FR-0720KL; MFR: Stackpole Electronics Inc; Published: 8-Jun-2000; LatestRevisionDate: 17-Jul-2002; LatestRevisionNote: Re-released for DXP Platform.; PackageReference: AXIAL-0.3; Publisher: Altium Limited; Value: 20K; Category: Chip Resistor - Surface Mount
R203 = Res1: RES 5.1K OHM 5% 1/8W 0402; MPN: AC0402FR-075K1L; MFR: Stackpole Electronics Inc; Published: 8-Jun-2000; LatestRevisionDate: 17-Jul-2002; LatestRevisionNote: Re-released for DXP Platform.; PackageReference: AXIAL-0.3; Publisher: Altium Limited; Value: 5.1K; Category: Chip Resistor - Surface Mount
R204 = Res1: RES 20K OHM 1% 1/8W 0402; MPN: RC0402FR-0720KL; MFR: YAGEO; Published: 8-Jun-2000; LatestRevisionDate: 17-Jul-2002; LatestRevisionNote: Re-released for DXP Platform.; PackageReference: AXIAL-0.3; Publisher: Altium Limited; Value: 20K; Category: Chip Resistor - Surface Mount
U202 = TLV1117LV33DCYR: 800mA and 1A Low Dropout Positive Regulator 3.3V; MPN: TLV1117LV33DCYR; Value: TLV1117LV33DCYR
R205 = NC: MPN: NC; Value: NC; Category: 0402

## Sheet HMS.VS1838B.SchDoc
size A
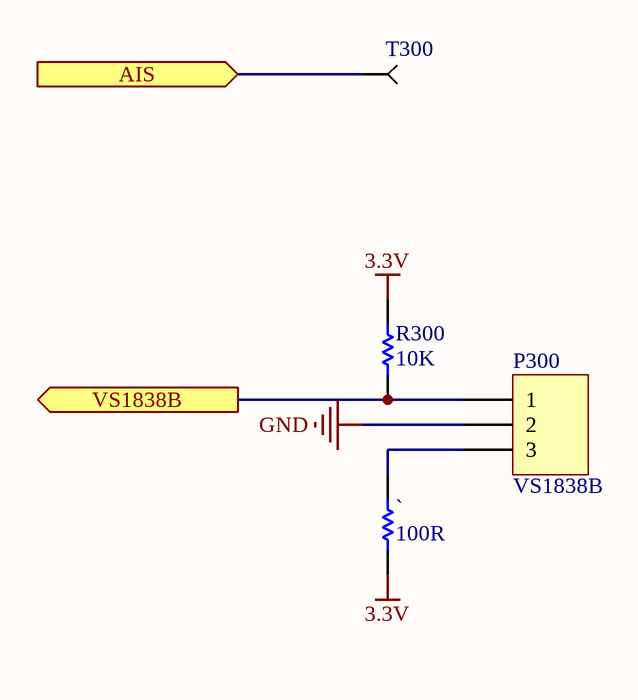
[diagram p5: HMS.VS1838B.SchDoc]

### Parts
`  100R  [RES_0402(1005)]
P300  VS1838B  [IR_RECEIVER]
R300  10K  [RES_0402(1005)]
T300  Test Point  [TP]  (value not drawn)

### Ports
AIS (in), VS1838B (out)

### Nets
3.3V: `.1 R300.2
GND: P300.2
Net`_2: `.2 P300.3
NetP300_1: P300.1 R300.1 ; port VS1838B
NetT300_1: T300.1 ; port AIS

### Library data of the parts
` = Res1: RES 100 OHM 1% 1/8W 0402; MPN: RC0402FR-7W100RL; Published: 8-Jun-2000; LatestRevisionDate: 17-Jul-2002; LatestRevisionNote: Re-released for DXP Platform.; PackageReference: AXIAL-0.3; Publisher: Altium Limited; Value: 100R
P300 = Header 3: Diode Infrared Receiver 38Khz; LatestRevisionDate: 17-Jul-2002; LatestRevisionNote: Re-released for DXP Platform.; Publisher: Altium Limited; Value: VS1838B; MPN: VS1838B
R300 = Res1: RES 10K OHM 5% 1/8W 0402; MPN: RC0402JR-0710KL; MFR: Yageo; Published: 8-Jun-2000; LatestRevisionDate: 17-Jul-2002; LatestRevisionNote: Re-released for DXP Platform.; PackageReference: AXIAL-0.3; Publisher: Altium Limited; Value: 10K

## Sheet HMS_NiMHCharge.SchDoc
size A
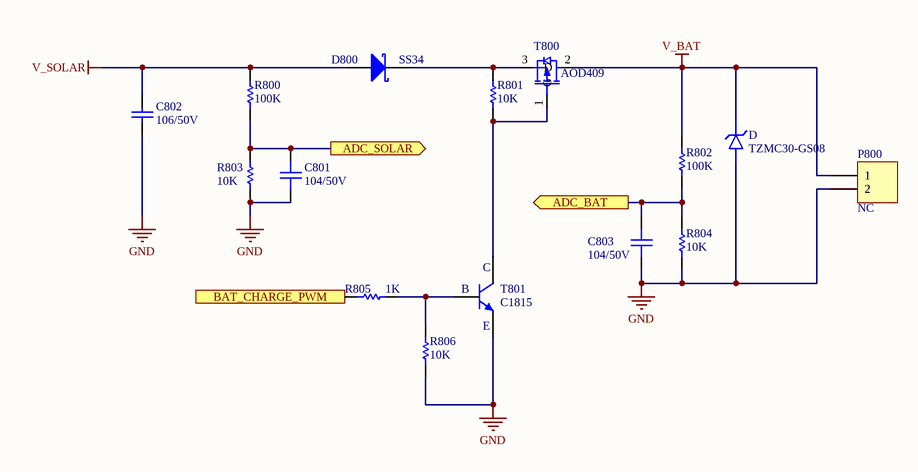
[diagram p6: HMS_NiMHCharge.SchDoc]

### Parts
C801  104/50V  [CAP_CERAMIC_0402(1005)]
C802  106/50V  [CAP_CERAMIC_1206(3216-18)]
C803  104/50V  [CAP_CERAMIC_0402(1005)]
D  TZMC30-GS08  [sod-80]
D800  SS34  [DO214AC_SMA_1808]
P800  NC  [H2_BIG]
R800  100K  [RES_0402(1005)]
R801  10K  [RES_0402(1005)]
R802  100K  [RES_0402(1005)]
R803  10K  [RES_0402(1005)]
R804  10K  [RES_0402(1005)]
R805  1K  [RES_0402(1005)]
R806  10K  [RES_0402(1005)]
T800  AOD409  [TO252]
T801  C1815  [SOT23-3]

### Ports
ADC_BAT (out), ADC_SOLAR (out), BAT_CHARGE_PWM (in)

### Nets
GND: C801.1 C802.2 C803.1 D.1 P800.2 R803.1 R804.1 R806.1 T801.2
V_BAT: D.2 P800.1 R802.2 T800.2(D)
V_SOLAR: C802.1 D800.1(A) R800.2
NetC801_2: C801.2 R800.1 R803.2 ; port ADC_SOLAR
NetC803_2: C803.2 R802.1 R804.2 ; port ADC_BAT
NetD800_2: D800.2(K) R801.2 T800.3(S)
NetR801_1: R801.1 T800.1(G) T801.3
NetR805_1: R805.1 ; port BAT_CHARGE_PWM
NetR805_2: R805.2 R806.2 T801.1

### Notes on the sheet
- (in symbol 2SC1815-HF) C; B; E

### Library data of the parts
C801 C803 = Cap Cer 0603 (1608): as C603 on sheet HMS.LedCtrl; Published: 8-Jun-2000; LatestRevisionDate: 17-Jul-2002; LatestRevisionNote: Re-released for DXP Platform.; PackageReference: RAD-0.3; Publisher: Altium Limited; Value: 104/50V
C802 = Cap: CAP Ceramic 106/50V 10% 1206; MPN: CL31A106KBHNNNE; Published: 8-Jun-2000; LatestRevisionDate: 17-Jul-2002; LatestRevisionNote: Re-released for DXP Platform.; PackageReference: RAD-0.3; Publisher: Altium Limited; Value: 106/50V
D = TZMC30-GS08: TZM Series 500 mW 32 V 5 % Tolerance Small Signal Zener Diode - SOD-80; Manufacturer: Vishay; Body Material: Glass; Breakdown Voltage: 30V; Current: 250mA; Element Configuration: Single; Forward Voltage: 1.5V; Impedance: 80Ω; Max Power Dissipation: 500mW; Max Reverse Leakage Current: 100nA; Number of Elements: 1; Peak Reverse Current: 2µA; Polarity: Unidirectional; Reverse Standoff Voltage: 22V; Test Current: 5mA; Tolerance: 5%; Working Voltage: 32V; Supplier 1: Arrow Electronics; MPN: TZMC30-GS08; RoHS: Compliant; Category: Zener Diodes; Stock 1: 37500; Pricing 1: 12500=0.0644, 25000=0.0562 (USD); Case/Package: SOD; China RoHS: Non-Compliant; Composition: Zener; Country of Origin: Germany, Japan; Export Control Classification Number (ECCN) Code: EAR99; Height: 1.6mm; Harmonized Tariff Schedule (HTS) Code: 8541.10.00.50; Introduction Date: 2000-08-07; Lead Free: Lead Free; Length: 3.7mm; Lifecycle Status: Production; Max Operating Temperature: 175°C; Min Operating Temperature: -65°C; Mount: Surface Mount; Number of Terminals: 2; Packaging: Cut Tape; Power Dissipation: 500mW; Radiation Hardening: No; Ratings: AEC-Q101; REACH SVHC: Unaffected; Reference Voltage: 30V; Voltage: 30V; Voltage Tolerance: 5%; Width: 1.6mm; Zener Current: 5mA; Zener Voltage: 30V; ComponentLink1URL: https://datasheet.octopart.com:443/TZMC30-GS08-Vishay-datasheet-140260254.pdf?src-supplier=Newark; ComponentLink1Description: https://datasheet.octopart.com:443/TZMC30-GS08-Vishay-datasheet-140260254.pdf?src-supplier=Newark; ComponentLink2URL: https://datasheet.octopart.com:443/TZMC30-GS08-Vishay-datasheet-68592862.pdf?src-supplier=Newark; ComponentLink2Description: https://datasheet.octopart.com:443/TZMC30-GS08-Vishay-datasheet-68592862.pdf?src-supplier=Newark; ComponentLink3URL: https://datasheet.octopart.com:443/TZMC30-GS08-Vishay-datasheet-33014479.pdf?src-supplier=Newark; ComponentLink3Description: https://datasheet.octopart.com:443/TZMC30-GS08-Vishay-datasheet-33014479.pdf?src-supplier=Newark; ComponentLink4URL: https://datasheet.octopart.com:443/TZMC30-GS08-Vishay-datasheet-21271070.pdf?src-supplier=Newark; ComponentLink4Description: https://datasheet.octopart.com:443/TZMC30-GS08-Vishay-datasheet-21271070.pdf?src-supplier=Newark; ComponentLink5URL: https://datasheet.octopart.com:443/TZMC30-GS08-Vishay-datasheet-7185.pdf?src-supplier=Newark; ComponentLink5Description: https://datasheet.octopart.com:443/TZMC30-GS08-Vishay-datasheet-7185.pdf?src-supplier=Newark; ComponentLink6URL: https://datasheet.octopart.com:443/TZMC30GS08-Vishay-datasheet-181484054.pdf?src-supplier=IHS; ComponentLink6Description: https://datasheet.octopart.com:443/TZMC30GS08-Vishay-datasheet-181484054.pdf?src-supplier=IHS; ComponentLink7URL: https://datasheet.octopart.com:443/TZMC30-GS08-Vishay-datasheet-78835411.pdf?src-supplier=Farnell; ComponentLink7Description: https://datasheet.octopart.com:443/TZMC30-GS08-Vishay-datasheet-78835411.pdf?src-supplier=Farnell; ComponentLink8URL: https://datasheet.octopart.com:443/TZMC30-GS08-Vishay-datasheet-101751705.pdf?src-supplier=Future+Electronics; ComponentLink8Description: https://datasheet.octopart.com:443/TZMC30-GS08-Vishay-datasheet-101751705.pdf?src-supplier=Future+Electronics; ComponentLink9URL: https://datasheet.octopart.com:443/TZMC30-GS08-Vishay-datasheet-13137935.pdf?src-supplier=Future+Electronics; ComponentLink9Description: https://datasheet.octopart.com:443/TZMC30-GS08-Vishay-datasheet-13137935.pdf?src-supplier=Future+Electronics; ComponentLink10URL: https://datasheet.octopart.com:443/TZMC30-GS08-Vishay-datasheet-11549796.pdf?src-supplier=Future+Electronics; ComponentLink10Description: https://datasheet.octopart.com:443/TZMC30-GS08-Vishay-datasheet-11549796.pdf?src-supplier=Future+Electronics; ComponentLink11URL: https://datasheet.octopart.com:443/TZMC30-GS08-Vishay-datasheet-8835337.pdf?src-supplier=Future+Electronics; ComponentLink11Description: https://datasheet.octopart.com:443/TZMC30-GS08-Vishay-datasheet-8835337.pdf?src-supplier=Future+Electronics; ComponentLink12URL: https://datasheet.octopart.com:443/TZMC30-GS08-Vishay-datasheet-8372199.pdf?src-supplier=Future+Electronics; ComponentLink12Description: https://datasheet.octopart.com:443/TZMC30-GS08-Vishay-datasheet-8372199.pdf?src-supplier=Future+Electronics; ComponentLink13URL: https://datasheet.octopart.com:443/TZMC30-GS08-Vishay-datasheet-5314236.pdf?src-supplier=Future+Electronics; ComponentLink13Description: https://datasheet.octopart.com:443/TZMC30-GS08-Vishay-datasheet-5314236.pdf?src-supplier=Future+Electronics; ComponentLink14URL: https://datasheet.octopart.com:443/TZMC30-GS08-Vishay-datasheet-42917902.pdf?src-supplier=TME; ComponentLink14Description: https://datasheet.octopart.com:443/TZMC30-GS08-Vishay-datasheet-42917902.pdf?src-supplier=TME; ComponentLink15URL: http://sigma.octopart.com:80/rohs_statement/Vishay-company-15.pdf?src-supplier=Compliance+Statements; ComponentLink15Description: http://sigma.octopart.com:80/rohs_statement/Vishay-company-15.pdf?src-supplier=Compliance+Statements; Supplier Part Number 1: TZMC30-GS08
D800 = Diode B340A: Diode Schottky 3A/40V DO-214AB; Published: 8-Jun-2000; LatestRevisionDate: 17-Jul-2002; LatestRevisionNote: Re-released for DXP Platform.; PackageReference: SMB; Publisher: Altium Limited; Code_JEDEC: DO-214-AA; Value: SS34; MPN: SS34
P800 = Header 2: Header, 2-Pin; LatestRevisionDate: 17-Jul-2002; LatestRevisionNote: Re-released for DXP Platform.; Publisher: Altium Limited; Value: NC
R800 R802 = Res1: Resistor 100K 1/8W 1% 0402; MPN: RC0402JR-07100KL; Published: 8-Jun-2000; LatestRevisionDate: 17-Jul-2002; LatestRevisionNote: Re-released for DXP Platform.; PackageReference: AXIAL-0.3; Publisher: Altium Limited; Value: 100K
R801 = Res1: RES 10K OHM 5% 1/8W 0402; Parameter 1: RC0402JR-0710KL; Published: 8-Jun-2000; LatestRevisionDate: 17-Jul-2002; LatestRevisionNote: Re-released for DXP Platform.; PackageReference: AXIAL-0.3; Publisher: Altium Limited; Value: 10K
R803 R804 R806 = Res1: as R601 on sheet HMS.LedCtrl; Published: 8-Jun-2000; LatestRevisionDate: 17-Jul-2002; LatestRevisionNote: Re-released for DXP Platform.; PackageReference: AXIAL-0.3; Publisher: Altium Limited; Value: 10K
R805 = Res1: Resistor 1K 1/8W 1% 0603; MPN: RC0402FR-071KL; Published: 8-Jun-2000; LatestRevisionDate: 17-Jul-2002; LatestRevisionNote: Re-released for DXP Platform.; PackageReference: AXIAL-0.3; Publisher: Altium Limited; Value: 1K
T800 = AOD4185: as T600 on sheet HMS.LedCtrl; Supplier 1: Digi-Key; RoHS: RoHS Compliant; Category: Discrete Semiconductor Products; Stock 1: 4068; Pricing 1: 1=0.6, 10=0.34, 25=0.2932, 50=0.2468, 100=0.2209, 250=0.20072, 500=0.18058, 1000=0.16904 (USD); Packaging: Digi-Reel®; Mounting Type: Surface Mount; Package / Case: TO-236-3, SC-59, SOT-23-3; Supplier Device Package: Micro3™/SOT-23; ComponentLink1URL: http://www.irf.com/product-info/datasheets/data/irlml6402gpbf.pdf; ComponentLink1Description: http://www.irf.com/product-info/datasheets/data/irlml6402gpbf.pdf; Supplier Part Number 1: IRLML6402GTRPBFDKR-ND; Value: AOD409; MPN: AOD409
T801 = 2SC1815-HF: Transistor  50V 150mA  NPN SMD SOT-23; Value: C1815; MPN: 2SC1815

## Sheet HMS_Solar.SchDoc
size A
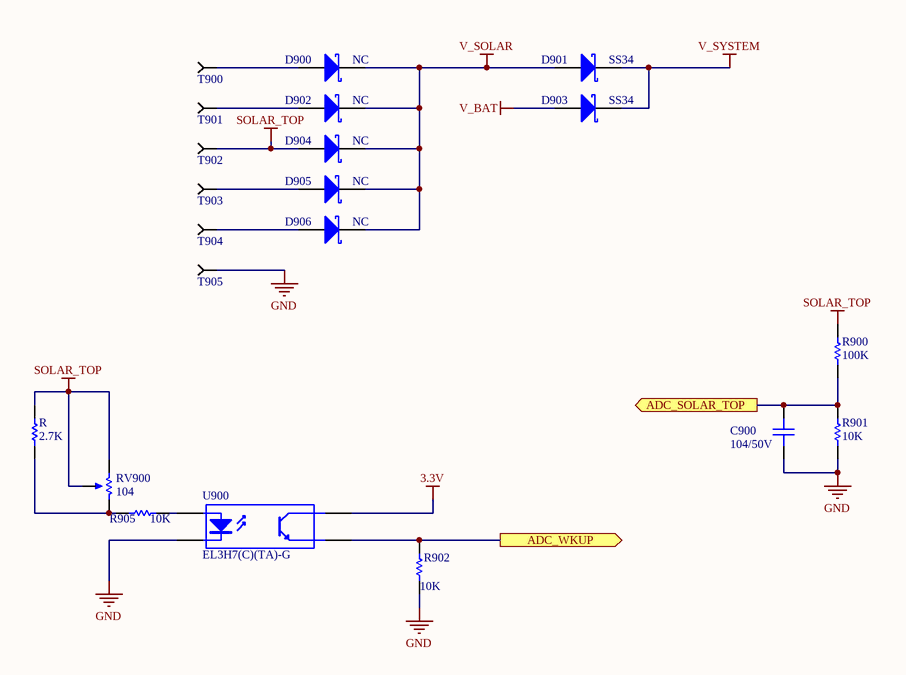
[diagram p7: HMS_Solar.SchDoc]

### Parts
C900  104/50V  [CAP_CERAMIC_0402(1005)]
D900  NC  [DO214AC_SMA_1808]
D901  SS34  [DO214AC_SMA_1808]
D902  NC  [DO214AC_SMA_1808]
D903  SS34  [DO214AC_SMA_1808]
D904  NC  [DO214AC_SMA_1808]
D905  NC  [DO214AC_SMA_1808]
D906  NC  [DO214AC_SMA_1808]
R  2.7K  [RES_0402(1005)]
R900  100K  [RES_0402(1005)]
R901  10K  [RES_0402(1005)]
R902  10K  [RES_0402(1005)]
R905  10K  [RES_0402(1005)]
RV900  104  [RES_VAR_Type1]
T900  Test Point  [TP_2]  (value not drawn)
T901  Test Point  [TP_2]  (value not drawn)
T902  Test Point  [TP_2]  (value not drawn)
T903  Test Point  [TP_2]  (value not drawn)
T904  Test Point  [TP_2]  (value not drawn)
T905  Test Point  [TP_2]  (value not drawn)
U900  EL3H7(C)(TA)-G  [Opto small]

### Ports
ADC_SOLAR_TOP (out), ADC_WKUP (out)

### Nets
3.3V: U900.4
GND: C900.1 R901.1 R902.1 T905.1 U900.2
SOLAR_TOP: D904.1(A) R.1 R900.2 RV900.2 RV900.3 T902.1
V_BAT: D903.1(A)
V_SOLAR: D900.2(K) D901.1(A) D902.2(K) D904.2(K) D905.2(K) D906.2(K)
V_SYSTEM: D901.2(K) D903.2(K)
NetC900_2: C900.2 R900.1 R901.2 ; port ADC_SOLAR_TOP
NetD900_1: D900.1(A) T900.1
NetD902_1: D902.1(A) T901.1
NetD905_1: D905.1(A) T903.1
NetD906_1: D906.1(A) T904.1
NetR902_2: R902.2 U900.3 ; port ADC_WKUP
NetR905_1: R905.1 U900.1
NetR_2: R.2 R905.2 RV900.1

### Library data of the parts
C900 = Cap Cer 0603 (1608): as C603 on sheet HMS.LedCtrl; Published: 8-Jun-2000; LatestRevisionDate: 17-Jul-2002; LatestRevisionNote: Re-released for DXP Platform.; PackageReference: RAD-0.3; Publisher: Altium Limited; Value: 104/50V
D900 D902 D904-D906 = Diode B340A: Diode Schottky 3A/40V DO-214AB; MPN: SS34; Published: 8-Jun-2000; LatestRevisionDate: 17-Jul-2002; LatestRevisionNote: Re-released for DXP Platform.; PackageReference: SMB; Publisher: Altium Limited; Code_JEDEC: DO-214-AA; Value: NC
D901 D903 = Diode B340A: Diode Schottky 3A/40V DO-214AB; Published: 8-Jun-2000; LatestRevisionDate: 17-Jul-2002; LatestRevisionNote: Re-released for DXP Platform.; PackageReference: SMB; Publisher: Altium Limited; Code_JEDEC: DO-214-AA; Value: SS34; MPN: SS34
R = Res1: RES 2.7K OHM 5% 1/8W 0402; MPN: RC0402JR-072K7L; MFR: YAGEO; Published: 8-Jun-2000; LatestRevisionDate: 17-Jul-2002; LatestRevisionNote: Re-released for DXP Platform.; PackageReference: AXIAL-0.3; Publisher: Altium Limited; PackageDescription: Axial Device, Thru-Hole; 2 Leads; 0.3 in Pin Spacing; Value: 2.7K; Category: Chip Resistor - Surface Mount
R900 = Res1: as R800 on sheet HMS_NiMHCharge; Published: 8-Jun-2000; LatestRevisionDate: 17-Jul-2002; LatestRevisionNote: Re-released for DXP Platform.; PackageReference: AXIAL-0.3; Publisher: Altium Limited; Value: 100K
R901 = Res1: as R601 on sheet HMS.LedCtrl; Published: 8-Jun-2000; LatestRevisionDate: 17-Jul-2002; LatestRevisionNote: Re-released for DXP Platform.; PackageReference: AXIAL-0.3; Publisher: Altium Limited; Value: 10K
R902 R905 = Res1: RES 10K OHM 5% 1/8W 0402; MPN: RC0402JR-0710KL; MFR: YAGEO; Published: 8-Jun-2000; LatestRevisionDate: 17-Jul-2002; LatestRevisionNote: Re-released for DXP Platform.; PackageReference: AXIAL-0.3; Publisher: Altium Limited; PackageDescription: Axial Device, Thru-Hole; 2 Leads; 0.3 in Pin Spacing; Value: 10K; Category: Chip Resistor - Surface Mount
RV900 = Res_Vol_Single: Volume Varistor Single 100K; MPN: 3296W-104; Sim Note: Enter the Resistance value and the set point into parameter fields.; Set Position: 0.5; Published: 8-Jun-2000; LatestRevisionDate: 17-Jul-2002; LatestRevisionNote: Re-released for DXP Platform.; PackageReference: VR5; Publisher: Altium Limited; Value: 104
U900 = OPTOISO1: Optoisolator Transistor Output 3750Vrms 1 Channel 4-SOP; MFR: Vishay Semiconductor Opto Division; Component Type: IC; MPN: EL3H7(C)(TA)-G; Value: EL3H7(C)(TA)-G; Category: Optoisolators - Transistor, Photovoltaic Output

## Sheet HMS.SIM.A7682S.SchDoc: HMS.SIM.A7682S
size A4
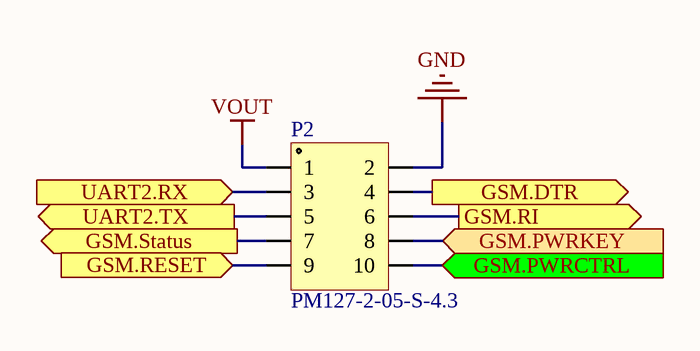
[diagram p8: HMS.SIM.A7682S.SchDoc]

### Parts
P2  PM127-2-05-S-4.3  [Female 127-2-05-s4.3]

### Ports
GSM.DTR (out), GSM.PWRCTRL (in), GSM.PWRKEY (in), GSM.RESET (in), GSM.RI (out), GSM.Status (out), UART2.RX (in), UART2.TX (out)

### Nets
GND: P2.2
VOUT: P2.1
USART2.TX: P2.3 ; port UART2.RX
NetP2_4: P2.4 ; port GSM.DTR
NetP2_5: P2.5 ; port UART2.TX
NetP2_6: P2.6 ; port GSM.RI
NetP2_7: P2.7 ; port GSM.Status
NetP2_8: P2.8 ; port GSM.PWRKEY
NetP2_9: P2.9 ; port GSM.RESET
NetP2_10: P2.10 ; port GSM.PWRCTRL

### Notes on the sheet
- Title
- Size:
- Date:
- A4
- Number:
- Time:
- Revision:
- Sheet
- of
- File:

### Library data of the parts
P2 = PM127-2-05-S-4.3: 1.27MM 2*5pin SMD Female Header Plastic Height4.3MM; Manufacturer: HCTL; Connector Type: Forked, Receptacle; Current Rating: 2A; Dielectric Material: Polyamide; Insulation Resistance: 5GΩ; Number of Contacts: 5; Number of Positions: 10; Supplier 1: Mouser; Manufacturer Part Number: PM127-2-05-S-4.3; RoHS: Compliant; Category: Card Edge Connectors; Stock 1: 1610; Pricing 1: 1=2, 10=1.79, 50=1.79, 100=1.7, 1000=1.22, 10000=1.18 (USD); China RoHS: Compliant; Color: Black; Contact Gender: Female; Contact Plating: Tin; Depth: 1.27mm; Export Control Classification Number (ECCN) Code: EAR99; Gender: Female; Height: 8.26mm; Housing Color: Black; Harmonized Tariff Schedule (HTS) Code: 8536.69.40.40; Insulation Color: Black; Introduction Date: 2007-03-15; Lead Free: Lead Free; Lifecycle Status: Production; Max Current Rating: 2A; Max Operating Temperature: 105°C; Min Operating Temperature: -40°C; Mount: Through Hole; Number of Rows: 2; Orientation: Straight; Packaging: Bulk; Pitch: 1.27mm; REACH SVHC: Unaffected; Terminal Pitch: 1.27mm; Termination: Solder; Width: 2.54mm; ComponentLink1URL: https://datasheet.octopart.com:443/929974-01-10-RK-3M-datasheet-24569739.pdf?src-supplier=IHS; ComponentLink1Description: https://datasheet.octopart.com:443/929974-01-10-RK-3M-datasheet-24569739.pdf?src-supplier=IHS; ComponentLink2URL: https://datasheet.octopart.com:443/80000909525-3M-datasheet-5391050.pdf?src-supplier=Arrow+Electronics; ComponentLink2Description: https://datasheet.octopart.com:443/80000909525-3M-datasheet-5391050.pdf?src-supplier=Arrow+Electronics; ComponentLink3URL: http://sigma.octopart.com:80/conflict_mineral_statement/3M-company-24.pdf?src-supplier=Compliance+Statements; ComponentLink3Description: http://sigma.octopart.com:80/conflict_mineral_statement/3M-company-24.pdf?src-supplier=Compliance+Statements; MPN: PM127-2-05-S-4.3; Value: PM127-2-05-S-4.3

## Sheet HMS.LC76G.SchDoc
size A4
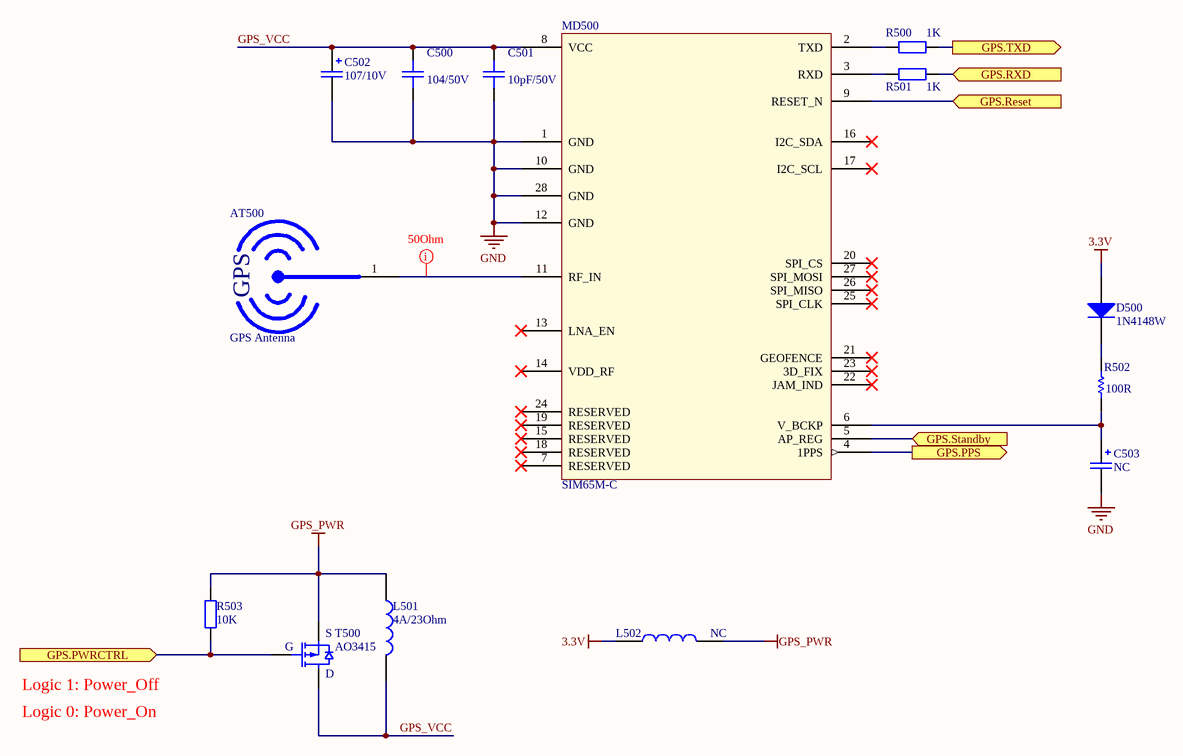
[diagram p9: HMS.LC76G.SchDoc]

### Parts
AT500  GPS Antenna  [ANT GPS Passive]
C500  104/50V  [CAP_CERAMIC_0402(1005)]
C501  10pF/50V  [CAP_CERAMIC_0402(1005)]
C502  107/10V  [CAP_TANTAL_1206(3216-18)]
C503  NC  [SPCAP0.22F]
D500  1N4148W  [DIODE_F03_1005]
L501  4A/23Ohm  [Inductor_0603]
L502  NC  [Inductor_0603]
MD500  SIM65M-C  [LC76G_GPS]
R500  1K  [RES_0402(1005)]
R501  1K  [RES_0402(1005)]
R502  100R  [RES_0402(1005)]
R503  10K  [RES_0402(1005)]
T500  AO3415  [SOT23-3]

### Ports
GPS.PPS (out), GPS.PWRCTRL (in), GPS.Reset (in), GPS.RXD (in), GPS.Standby (in), GPS.TXD (out)

### Nets
3.3V: D500.1(A) L502.1
GND: C500.1 C501.1 C502.2 C503.2 MD500.1(GND) MD500.10(GND) MD500.12(GND) MD500.28(GND)
GPS_PWR: L501.1 L502.2 R503.2 T500.2(S)
GPS_VCC: C500.2 C501.2 C502.1 L501.2 MD500.8(VCC) T500.3(D)
NetAT500_1: AT500.1 MD500.11(RF_IN)
NetC503_1: C503.1 MD500.6(V_BCKP) R502.1
NetD500_2: D500.2(K) R502.2
NetMD500_2: MD500.2(TXD) R500.1
NetMD500_3: MD500.3(RXD) R501.1
NetMD500_4: MD500.4(1PPS) ; port GPS.PPS
NetMD500_5: MD500.5(AP_REG) ; port GPS.Standby
NetMD500_9: MD500.9(RESET_N) ; port GPS.Reset
NetR500_2: R500.2 ; port GPS.TXD
NetR501_2: R501.2 ; port GPS.RXD
NetR503_1: R503.1 T500.1(G) ; port GPS.PWRCTRL

Not connected (* = marked no-connect by the designer): MD500 7(RESERVED)* 13(LNA_EN)* 14(VDD_RF)* 15(RESERVED)* 16(I2C_SDA)* 17(I2C_SCL)* 18(RESERVED)* 19(RESERVED)* 20(SPI_CS)* 21(GEOFENCE)* 22(JAM_IND)* 23(3D_FIX)* 24(RESERVED)* 25(SPI_CLK)* 26(SPI_MISO)* 27(SPI_MOSI)*

### Layout directives
net class 50Ohm: NetAT500_1

### Notes on the sheet
- Logic 1: Power_Off
- Logic 0: Power_On
- (in symbol Antenna GPS Passive) GPS

### Library data of the parts
AT500 = Antenna GPS Passive: SWG018-35, Passive antenna 25x25x4mm, pin length 3.5mm, Three-proof varnish; MPN: SW25073IB93; Value: GPS Antenna
C500 C501 = Cap Cer 0603 (1608): as C200 on sheet HMS.Power; Published: 8-Jun-2000; LatestRevisionDate: 17-Jul-2002; LatestRevisionNote: Re-released for DXP Platform.; PackageReference: RAD-0.3; Publisher: Altium Limited; Category: Ceramic Capacitors
  C500: Value: 104/50V
  C501: Value: 10pF/50V
C502 = Cap Tantal 2312 (6032-28): Cap Tantal 10uF/6.3V 10% 1206; MPN: 293D106X96R3A2TE3; Value: 107/10V
C503 = DCK-3R3E224U-E: MFR: Elna America; Capacitance: 220mF; Voltage - Rated: 3.3V; Tolerance: -20%, +80%; ESR (Equivalent Series Resistance): 200 Ohm; Lifetime @ Temp.: 1000 Hrs @ 60°C; Published: 24-Mar-1999; LatestRevisionDate: 17-Jul-2002; LatestRevisionNote: Re-released for DXP Platform.; PackageReference: BAT-2; Publisher: Altium Limited; PackageDescription: Battery; 2 Leads; Supplier 1: Digi-Key; MPN: NC; RoHS: RoHS Compliant; Category: Capacitors; Stock 1: 7810; Pricing 1: 1=1.41, 10=1.114, 25=1.0208, 50=0.9652, 100=0.8352, 250=0.7424, 500=0.63104, 1000=0.5568, 2500=0.51968 (USD); Packaging: Bulk; Mounting Type: Surface Mount; Package / Case: Coin, Wide Terminals - Opposite Sides; Lead Spacing: 0.079" (2.00mm); Size / Dimension: 0.268" Dia (6.80mm); Height - Seated (Max): 0.083" (2.10mm); Operating Temperature: -10°C ~ 60°C; ComponentLink1URL: http://media.digikey.com/pdf/Data%20Sheets/Elna%20America%20Inc/DC_DCKe.pdf; ComponentLink1Description: http://media.digikey.com/pdf/Data%20Sheets/Elna%20America%20Inc/DC_DCKe.pdf; Supplier Part Number 1: 604-1007-ND; Value: NC
D500 = Diode F03: 1N4148 T4 SOD-123/1206 1N4148W; MFR: LinhKienChatLuong; Value: 1N4148W; Category: Diode; MPN: 1N4148W
L501 = FBMJ1608HM230NT: Inductor Ferrites 4A SMD 0603; MPN: NC; MFR: Taiyo Yuden; Category: Ferrite Beads and Chips; Value: 4A/23Ohm
L502 = CBC2012T470M: 47nH; Manufacturer: Taiyo Yuden; Inductance: 200nH; Current Rating: 150mA; Current - Saturation: 120mA; Tolerance: ±20%; Shielding: Unshielded; DC Resistance (DCR): 7.54 Ohm Max; Frequency - Self Resonant: 11MHz; Frequency - Test: 2.52MHz; Supplier 1: Digi-Key; Manufacturer Part Number: CBC2012T470M; RoHS: RoHS Compliant; Category: Inductors, Coils, Chokes; Stock 1: 108934; Pricing 1: 1=0.2, 10=0.188, 50=0.1762, 100=0.1645, 500=0.12926, 1000=0.10575 (USD); Packaging: Cut Tape (CT); Type: -; Material - Core: -; Q @ Freq: -; Operating Temperature: -40°C ~ 105°C; Package / Case: 0805 (2012 Metric); Size / Dimension: 0.079" L x 0.049" W x 0.049" H (2.00mm x 1.25mm x 1.25mm); Mounting Type: Surface Mount; ComponentLink1URL: http://www.yuden.co.jp/ut/product/category/inductor/CBC2012T470M.pdf; ComponentLink1Description: http://www.yuden.co.jp/ut/product/category/inductor/CBC2012T470M.pdf; Supplier Part Number 1: 587-1605-1-ND; Value: NC; MPN: NC
MD500 = LC76G: Compact GNSS Module; MPN: SIM65M-C; Value: SIM65M-C
R500 = RC0402FR-071KL: RES 1K OHM 1% 1/8W 0402; MFR: YAGEO; Voltage Rating: 50V; Power Rating: 1/16W; Value: 1K; MPN: RC0402FR-071KL; Category: 0402; Tolerance: 1%
R501 = RC0402FR-071KL: RES 1K OHM 1% 1/8W 0402; MPN: RC0402FR-131KL; MFR: YAGEO; Voltage Rating: 50V; Power Rating: 1/16W; Value: 1K; Category: 0402; Tolerance: 1%
R502 = Res1: RES 100 OHM 1% 1/8W 0402; MPN: RC0402FR-7W100RL; MFR: Vishay Dale; Published: 8-Jun-2000; LatestRevisionDate: 17-Jul-2002; LatestRevisionNote: Re-released for DXP Platform.; PackageReference: AXIAL-0.3; Publisher: Altium Limited; Value: 100R; Category: Chip Resistor - Surface Mount
R503 = RC0402JR-0710KL: RES 10K OHM 5% 1/8W 0402; MFR: YAGEO; MPN: RC0402JR-0710KL; Category: Chip Resistor - Surface Mount; Value: 10K
T500 = A03415: Mosfet P Channel; MPN: AO3415; Category: Transistor PNP; Value: AO3415